# Altium project DRVB701E_BSC011N03LSI.PrjPcb
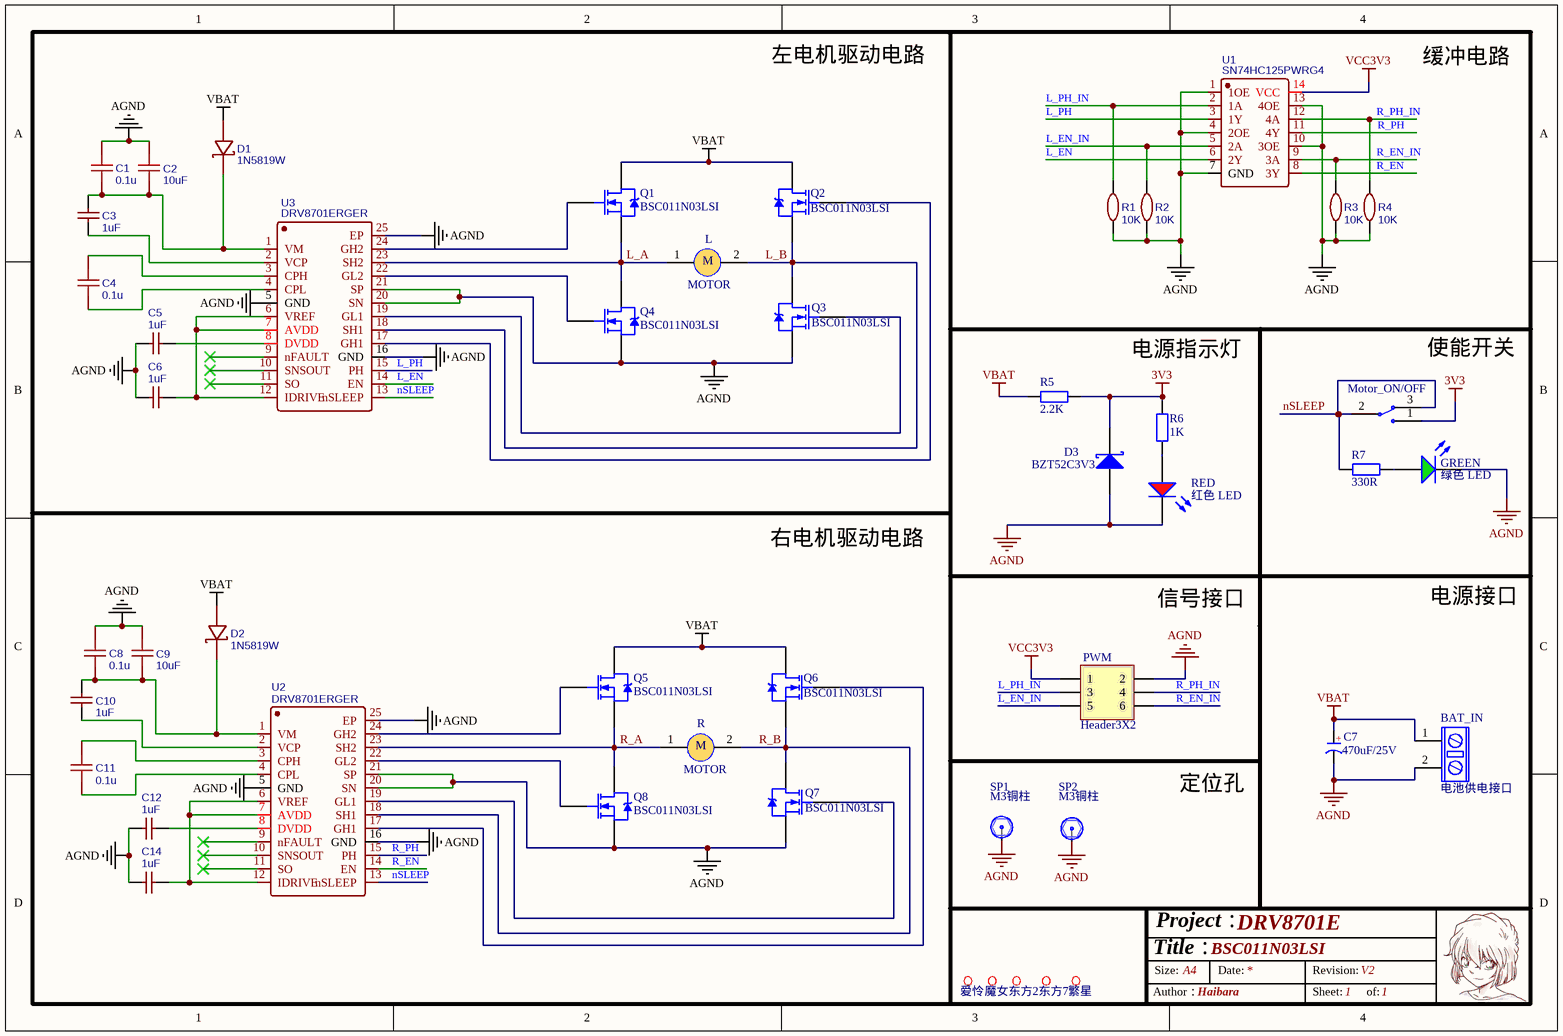
[diagram p0: DRV8701E_BSC011N03LSI.schdoc]
1 sheet, 48 parts. Net scope: global (net labels, ports and power ports of the same name join across sheets).
Board file: DRV8701E_BSC011N03LSI.PcbDoc

## Sheet DRV8701E_BSC011N03LSI.schdoc: BSC011N03LSI
size A4; Revision: V2; SheetNumber: 1; SheetTotal: 1; Project: DRV8701E

### Parts
(Parts that share a designator on the sheet are numbered #1, #2 ... from top to bottom, then left to right.)
?#1  爱怜  [爱怜]
?#2  魔女  [魔女小]
?#3  东方2  [IMPORTED_IMAGE - duplicate16]
?#4  繁星  [繁星]
?#5  东方7  [IMPORTED_IMAGE - duplicate11]
BAT_IN  电池供电接口  [XT30 母头 电源插头]
C1  0.1u  [C0603]
C2  10uF  [C0805]
C3  1uF  [C0603]
C4  0.1u  [C0603]
C5  1uF  [C0603]
C6  1uF  [C0603]
C7  470uF/25V  [CS 5.0*10*13 - V]
C8  0.1u  [C0603]
C9  10uF  [C0805]
C10  1uF  [C0603]
C11  0.1u  [C0603]
C12  1uF  [C0603]
C14  1uF  [C0603]
D1  1N5819W  [SOD-123F_L2.8-W1.8-LS3.7-RD]
D2  1N5819W  [SOD-123F_L2.8-W1.8-LS3.7-RD]
D3  BZT52C3V3  [SOD-323]
GREEN  绿色 LED  [0603 LED G]
L  MOTOR  [XT30 母头 电源插头]
Motor_ON/OFF  开关  [MTS-102S 两档纽子开关]  (value not drawn)
PWM  Header3X2  [MX 1.25-WS-6P]
Q1  BSC011N03LSI  [PSON-8 MOS]
Q2  BSC011N03LSI  [PSON-8 MOS]
Q3  BSC011N03LSI  [PSON-8 MOS]
Q4  BSC011N03LSI  [PSON-8 MOS]
Q5  BSC011N03LSI  [PSON-8 MOS]
Q6  BSC011N03LSI  [PSON-8 MOS]
Q7  BSC011N03LSI  [PSON-8 MOS]
Q8  BSC011N03LSI  [PSON-8 MOS]
R  MOTOR  [XT30 母头 电源插头]
R1  10K  [R0603]
R2  10K  [R0603]
R3  10K  [R0603]
R4  10K  [R0603]
R5  2.2K  [R0603]
R6  1K  [R0603]
R7  330R  [R0603]
RED  红色 LED  [0603 LED R]
SP1  M3铜柱  [MTGP720H320V6P - duplicate]
SP2  M3铜柱  [MTGP720H320V6P - duplicate]
U1  SN74HC125PWRG4  [TSSOP-14_L5.0-W4.4-P0.65-LS6.4-TL]
U2  DRV8701ERGER  [VQFN-24_L4.0-W4.0-P0.50-BL-EP2.8]
U3  DRV8701ERGER  [VQFN-24_L4.0-W4.0-P0.50-BL-EP2.8]

### Nets
3V3: D3.2(K) Motor_ON/OFF.1 R5.2 R6.2
AGND: BAT_IN.2 C1.2 C2.1 C5.2 C6.2 C7.2(K) C8.2 C9.1 C12.2 C14.2 D3.1(A) GREEN.2 PWM.2 Q3.1(S) Q4.1(S) Q7.1(S) Q8.1(S) R1.1 R2.1 R3.1 R4.1 RED.2 SP1.1 SP2.1 U1.1(1OE) U1.4(2OE) U1.7(GND) U1.10(3OE) U1.13(4OE) U2.5(GND) U2.16(GND) U2.20(SN) U2.21(SP) U2.25(EP) U3.5(GND) U3.16(GND) U3.20(SN) U3.21(SP) U3.25(EP)
VBAT: BAT_IN.1 C7.1(A) D1.2 D2.2 Q1.3(D) Q2.3(D) Q5.3(D) Q6.3(D) R5.1
VCC3V3: PWM.1 U1.14(VCC)
L_A: L.1 Q1.1(S) Q4.3(D) U3.23(SH2)
L_B: L.2 Q2.1(S) Q3.3(D) U3.18(SH1)
L_EN: U1.6(2Y) U3.14(EN)
L_EN_IN: PWM.5 R2.2 U1.5(2A)
L_PH: U1.3(1Y) U3.15(PH)
L_PH_IN: PWM.3 R1.2 U1.2(1A)
nSLEEP: Motor_ON/OFF.2 Motor_ON/OFF.3 R7.1 U2.13(nSLEEP) U3.13(nSLEEP)
R_A: Q5.1(S) Q8.3(D) R.1 U2.23(SH2)
R_B: Q6.1(S) Q7.3(D) R.2 U2.18(SH1)
R_EN: U1.8(3Y) U2.14(EN)
R_EN_IN: PWM.6 R3.2 U1.9(3A)
R_PH: U1.11(4Y) U2.15(PH)
R_PH_IN: PWM.4 R4.2 U1.12(4A)
NetC1_1: C1.1 C2.2 C3.2 D1.1 U3.1(VM)
NetC3_1: C3.1 U3.2(VCP)
NetC4_1: C4.1 U3.4(CPL)
NetC4_2: C4.2 U3.3(CPH)
NetC5_1: C5.1 U3.8(DVDD)
NetC6_1: C6.1 U3.6(VREF) U3.7(AVDD) U3.12(IDRIVE)
NetC8_1: C8.1 C9.2 C10.2 D2.1 U2.1(VM)
NetC10_1: C10.1 U2.2(VCP)
NetC11_1: C11.1 U2.4(CPL)
NetC11_2: C11.2 U2.3(CPH)
NetC12_1: C12.1 U2.8(DVDD)
NetC14_1: C14.1 U2.6(VREF) U2.7(AVDD) U2.12(IDRIVE)
NetGREEN_1: GREEN.1 R7.2
NetQ1_2: Q1.2(G) U3.24(GH2)
NetQ2_2: Q2.2(G) U3.17(GH1)
NetQ3_2: Q3.2(G) U3.19(GL1)
NetQ4_2: Q4.2(G) U3.22(GL2)
NetQ5_2: Q5.2(G) U2.24(GH2)
NetQ6_2: Q6.2(G) U2.17(GH1)
NetQ7_2: Q7.2(G) U2.19(GL1)
NetQ8_2: Q8.2(G) U2.22(GL2)
NetR6_1: R6.1 RED.1

Not connected (* = marked no-connect by the designer): U2 9(nFAULT)* 10(SNSOUT)* 11(SO)*; U3 9(nFAULT)* 10(SNSOUT)* 11(SO)*

### Notes on the sheet
- 左电机驱动电路
- 缓冲电路
- 电源指示灯
- 使能开关
- 右电机驱动电路
- 信号接口
- 电源接口
- 定位孔
- Title：
- Size:
- Project：
- A4
- Date:
- Revision:
- Author：
- Haibara
- Sheet:
- of:
- (in symbol CE) +
- (in symbol MOTOR1) M

### Library data of the parts
BAT_IN = 电机供电接口
C1 C4 C8 C11 = 0.1u: nameAlias: Value(F); Contributor: LCEDA_Lib; spicePre: C; spiceSymbolName: C_0603_US
C2 C9 = 10uF: BOM_Manufacturer: Huaxin S&T; BOM_Manufacturer Part: 0805F106Z160CT; nameAlias: Capacitance; Contributor: LCSC; BOM_Supplier: LCSC; BOM_Supplier Part: C303921; BOM_JLCPCB Part Class: Extended Part; spicePre: C; spiceSymbolName: 0805F106Z160CT
C3 C5 C6 C10 C12 C14 = 1uF: BOM_Manufacturer Part: CL10B105KO8NNNC; BOM_Manufacturer: SAMSUNG; nameAlias: Capacitance; BOM_Supplier: LCSC; BOM_Supplier Part: C59782; BOM_JLCPCB Part Class: Extended Part; spicePre: C; spiceSymbolName: CL10B105KO8NNNC
C7 = CE
D1 D2 = 1N5819W: BOM_Manufacturer: Shandong Jingdao Microelectronics; Contributor: LCSC; BOM_Supplier: LCSC; BOM_Supplier Part: C169540; BOM_Manufacturer Part: 1N5819W; BOM_JLCPCB Part Class: Extended Part; spicePre: D; spiceSymbolName: 1N5819W
D3 = 1N5819: 肖特基二极管; 淘宝ID: 封装库来自淘宝 ID：黄晶宝石; 属性: 40V/2A; BOM名称: 肖特基二极管; 欢迎光临: https://shop463601444.taobao.com
GREEN = 绿灯: 发光二极管; ComponentLink1Description: 供应商链接; ComponentLink1URL: http://www.szlcsc.com/product/details_2670.html; Package: 0805; Supplier: LC; SuppliersPartNumber: C2297
L R = MOTOR1
PWM = Header 3X2: 3*2P接插件; 版权归属: 封装库来自淘宝 ID：黄晶宝石; BOM名称: 3*2P接插件; 学习资源: https://shop463601444.taobao.com
Q1-Q8 = NMOS: N-Channel Power MOSFET 40V 100A 1.8mΩ; Note: Pin 2 is electrically connected to pin 4.; Published: 8-Jun-2000; LatestRevisionDate: 17-Jul-2002; LatestRevisionNote: Re-released for DXP Platform.; DatasheetVersion: PD-9.814; PackageVersion: Feb-1997; PackageReference: TO-220AB; Publisher: Altium Limited; PackageDescription: TO, Thru-Hole, Vertical, Heatsink Mounted; 3 In-Line Leads; Pitch 2.54 mm; ComponentLink1Description: Manufacturer Link; ComponentLink1URL: http://www.irf.com/
R1-R4 = 10K: BOM_Manufacturer: YAGEO; BOM_Manufacturer Part: RT0603BRD0710KL; nameAlias: Resistance (Ohms); Resistance: 10kΩ; BOM_Supplier: LCSC; BOM_Supplier Part: C95204; BOM_JLCPCB Part Class: Extended Part; spicePre: R; spiceSymbolName: RT0603BRD0710KL
R5-R7 = R_MPR: 5W无感水泥电阻; BOM名称: 大功率电阻; 版权归属: 封装库来自淘宝 ID：黄晶宝石; 联系售后: https://shop463601444.taobao.com
RED = 红灯: 发光二极管; ComponentLink1Description: 供应商链接; ComponentLink1URL: http://www.szlcsc.com/product/details_2668.html; Package: 0805; Supplier: LC; SuppliersPartNumber: C2295
SP1 SP2 = 铜柱加头大焊盘: 铜柱; 版权归属: 源创客; BOM名称: 铜柱; 学习资源: www.ooocke.com
U1 = SN74HC125PWRG4: BOM_Manufacturer: TI(德州仪器); Contributor: LCSC; BOM_Supplier: LCSC; BOM_Supplier Part: C2676184; BOM_Manufacturer Part: SN74HC125PWRG4; BOM_JLCPCB Part Class: Extended Part; spicePre: U; spiceSymbolName: SN74HC125PWRG4
U2 U3 = DRV8701ERGER: BOM_Manufacturer: Texas Instruments; Contributor: LCSC; BOM_Supplier: LCSC; BOM_Supplier Part: C90964; BOM_Manufacturer Part: DRV8701ERGER; BOM_JLCPCB Part Class: Extended Part; spicePre: U; spiceSymbolName: DRV8701ERGER